# Altium schematic sheet LCD_Connectors.SchDoc
size A4; SheetNumber: 1; SheetTotal: 1
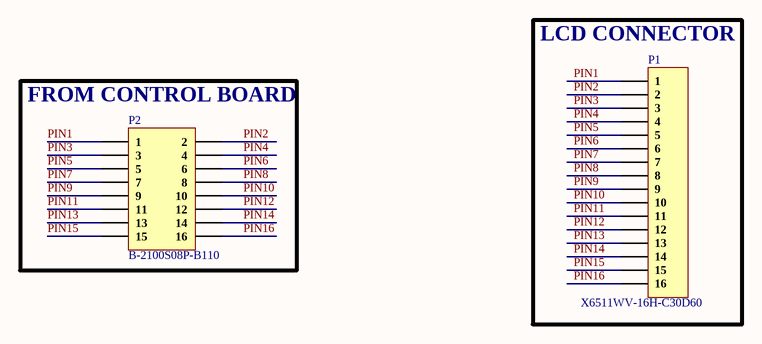
[diagram p0: LCD_Connectors.SchDoc]

## Parts
P1  X6511WV-16H-C30D60  [X6511WV-16H-C30D60]
P2  B-2100S08P-B110  [B-2100S08P-B110]

## Blocks framed on the sheet
LCD CONNECTOR: P1
FROM CONTROL BOARD: P2

## Nets
PIN1: P1.1 P2.1
PIN2: P1.2 P2.2
PIN3: P1.3 P2.3
PIN4: P1.4 P2.4
PIN5: P1.5 P2.5
PIN6: P1.6 P2.6
PIN7: P1.7 P2.7
PIN8: P1.8 P2.8
PIN9: P1.9 P2.9
PIN10: P1.10 P2.10
PIN11: P1.11 P2.11
PIN12: P1.12 P2.12
PIN13: P1.13 P2.13
PIN14: P1.14 P2.14
PIN15: P1.15 P2.15
PIN16: P1.16 P2.16

## Notes on the sheet
- 1
- Huzaifa Ali

## Library data of the parts
P1 = X6511WV-16H-C30D60: Manufacturer: XKB Connectivity; Pitch: 2.54mm; Current Rating (Max): 3A; Mounting Type: Straight
P2 = B-2100S08P-B110: Straight 2.54mm 6mm -40℃~+105℃ 2 3mm 8 2.54mm Black Brass 2x4P 2.54mm Plugin,P=2.54mm Pin Headers; Manufacturer: Ckmtw(Shenzhen Cankemeng); Mounting Type: Straight; Insulation Height: 2.54mm; Length of Mating Pin: 6mm; Operating Temperature Range: -40℃~+105℃; Number of Rows: 2; Length of End Connection Pin: 3mm